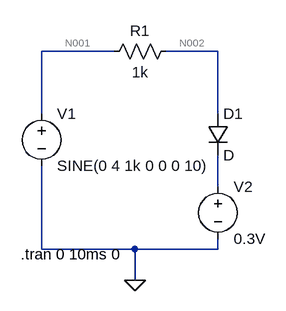
[diagram p0: schematic clipper.asc]
clipper.asc, the LTspice schematic file:
Version 4.1
SHEET 1 880 680
WIRE 16 -240 -96 -240
WIRE 176 -240 96 -240
WIRE -96 -144 -96 -240
WIRE 176 -144 176 -240
WIRE 176 -32 176 -80
WIRE -96 64 -96 -64
WIRE 48 64 -96 64
WIRE 176 64 176 48
WIRE 176 64 48 64
WIRE 48 112 48 64
FLAG 48 112 0
SYMBOL voltage -96 -160 R0
WINDOW 123 0 0 Left 0
WINDOW 39 0 0 Left 0
SYMATTR InstName V1
SYMATTR Value SINE(0 4 1k 0 0 0 10)
SYMBOL res 112 -256 R90
WINDOW 0 0 56 VBottom 2
WINDOW 3 32 56 VTop 2
SYMATTR InstName R1
SYMATTR Value 1k
SYMBOL voltage 176 -48 R0
WINDOW 123 0 0 Left 0
WINDOW 39 0 0 Left 0
SYMATTR InstName V2
SYMATTR Value 0.3V
SYMBOL diode 160 -144 R0
SYMATTR InstName D1
TEXT -128 72 Left 2 !.tran 0 10ms 0

The netlist it stands for:
* clipper.asc
V1 N001 0 SINE(0 4 1k 0 0 0 10)
R1 N002 N001 1k
V2 N003 0 0.3V
D1 N002 N003 D
.model D D
.lib standard.dio
.tran 0 10ms 0
.backanno
.end

* Results of the author's LTspice run, read from the files saved beside the schematic
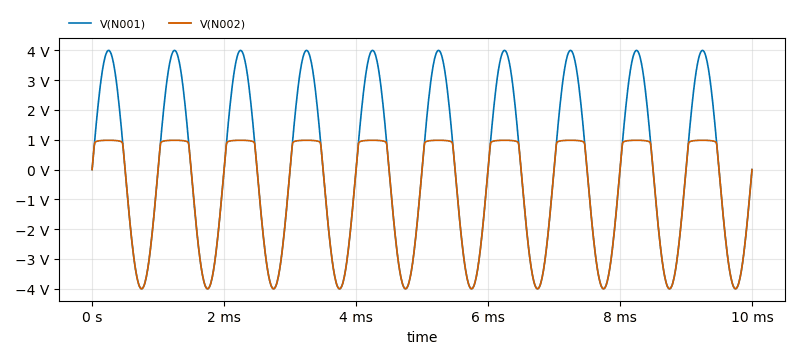
[diagram p1: Transient Analysis of clipper.asc, plotted from the saved traces]
* Transient Analysis, 1 run:
*   V(N001): min -4 V, max 4 V, average 0 V, rms 2.828 V, last 0 V
*   V(N002): min -4 V, max 983.7 mV, average -827.3 mV, rms 2.102 V, last 0 V